# EasyEDA Pro project stripline4.epro

# Board PCB1
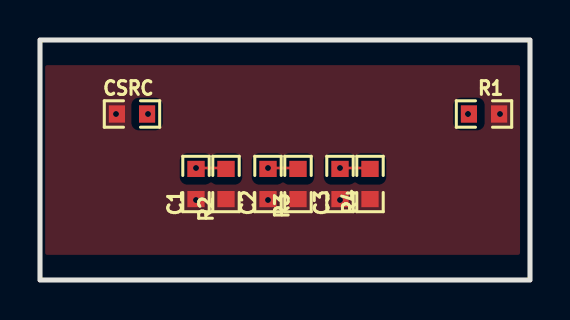
[diagram p0: board, top side]
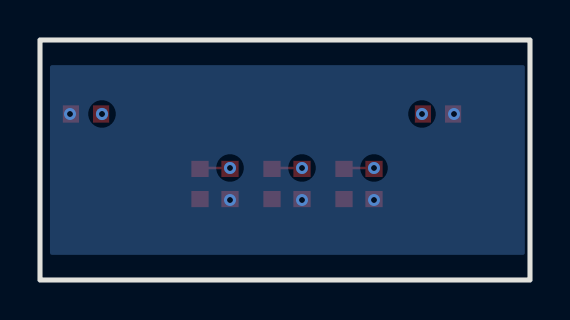
[diagram p1: board, bottom side, seen from below]

Outline 24.5 x 12 mm; copper layers: Top Layer, Inner1, Inner2, Bottom Layer. Coordinates in mm from the lower left corner of the outline.
Outline path: rectangle 0,12 24.5,0
Stack: Top Layer 0.035mm Outer layer thickness 1oz / Dielectric1 0.2mm 7628 RC49% 8.6mil / Inner1 0.35mm Inner layer thickness / Dielectric2 0.2mm 1.1mm H/HOZ Copper / Inner2 0.35mm Inner layer thickness / Dielectric3 0.2mm 7628 RC49% 8.6mil / Bottom Layer 0.035mm Outer layer thickness 1oz

## Design rules (mm)
template: Custom Config
spacing copperThickness1oz (default): track to track 0.102, other pairs 0.152 to 0.3
spacing copperThickness2oz: track to track 0.203, other pairs 0.152 to 0.3
track width copperThickness1oz (default): min 0.127, default 0.254, max 2.54
track width copperThickness2oz: min 0.203, default 0.254, max 2.54
differential pair differentialPair (default): width min 0.127, default 0.254, max 2.54; gap min 0.152, default 0.152
via viaSize (default): diameter min 0.5, default 0.61, max 10; hole min 0.3, default 0.305, max 6.3
pour e27 uses copperRegion

## Placement (name value [footprint] x y rotation side)
C1  1uF  [R0603]  7.8 4.8 270 top
C2  1uF  [R0603]  11.4 4.8 270 top
C3  1uF  [R0603]  15 4.8 270 top
CSRC  0  [R0603]  4.6 8.3 0 top
R1  50Ω  [R0603]  22.2 8.3 180 top
R2  50Ω  [R0603]  9.3 4.8 90 top
R3  50Ω  [R0603]  12.9 4.8 90 top
R4  50Ω  [R0603]  16.5 4.8 90 top

## Footprints (pads in the part's own frame, mm; a bottom-side part is the same pattern mirrored in y, then rotated)
R0603
  rect 0.806x0.864 smd: 1(-0.753,0) 2(0.753,0)

## Nets
1V: C3.1 R4.2
3V: C2.1 R3.2
+5V: C1.1 R2.2
GND: C1.2 C2.2 C3.2 CSRC.1 R1.1 R2.1 R3.1 R4.1
TX: CSRC.2 R1.2

## Via types
v1: diameter 0.6, hole 0.3, Top Layer to Bottom Layer, 9 vias
v2: diameter 0.61, hole 0.305, Top Layer to Bottom Layer, 1 via

## Routing (per net, layer and track width the routed paths; a pad name or vN(x,y) marks a point on that pad's centre or on a via; arc(x,y) is an arc through that point)
1V: length 1.5
  Top Layer w0.127: 16.5,5.5 16.4,5.6 v1(15,5.6)
3V: length 1.5
  Top Layer w0.127: 12.9,5.5 12.8,5.6 v1(11.4,5.6)
+5V: length 1.4
  Top Layer w0.127: 9.3,5.6 7.9,5.6
  vias: v1(7.8,5.6)
GND:
  vias: v1(3.8,8.3) v1(7.8,4) v1(11.4,4) v1(15,4) v1(23,8.3)
TX: length 16
  Inner1 w0.127: v1(5.4,8.3) v2(21.4,8.3)

## Copper pours and planes (outline as drawn; the poured copper is in the pictures)
GND on Top Layer: 0,11 24,11 24,1 0,1
GND on Bottom Layer: 0,11 24,11 24,1 0,1
GND on Inner1: 0,11 24,11 24,1 0,1
GND on Inner2: 0,11 24,11 24,1 0,1
